# Altium schematic sheet CAN-Sheet.SchDoc
size 420 x 297 mm; SheetNumber: 4; SheetTotal: 7
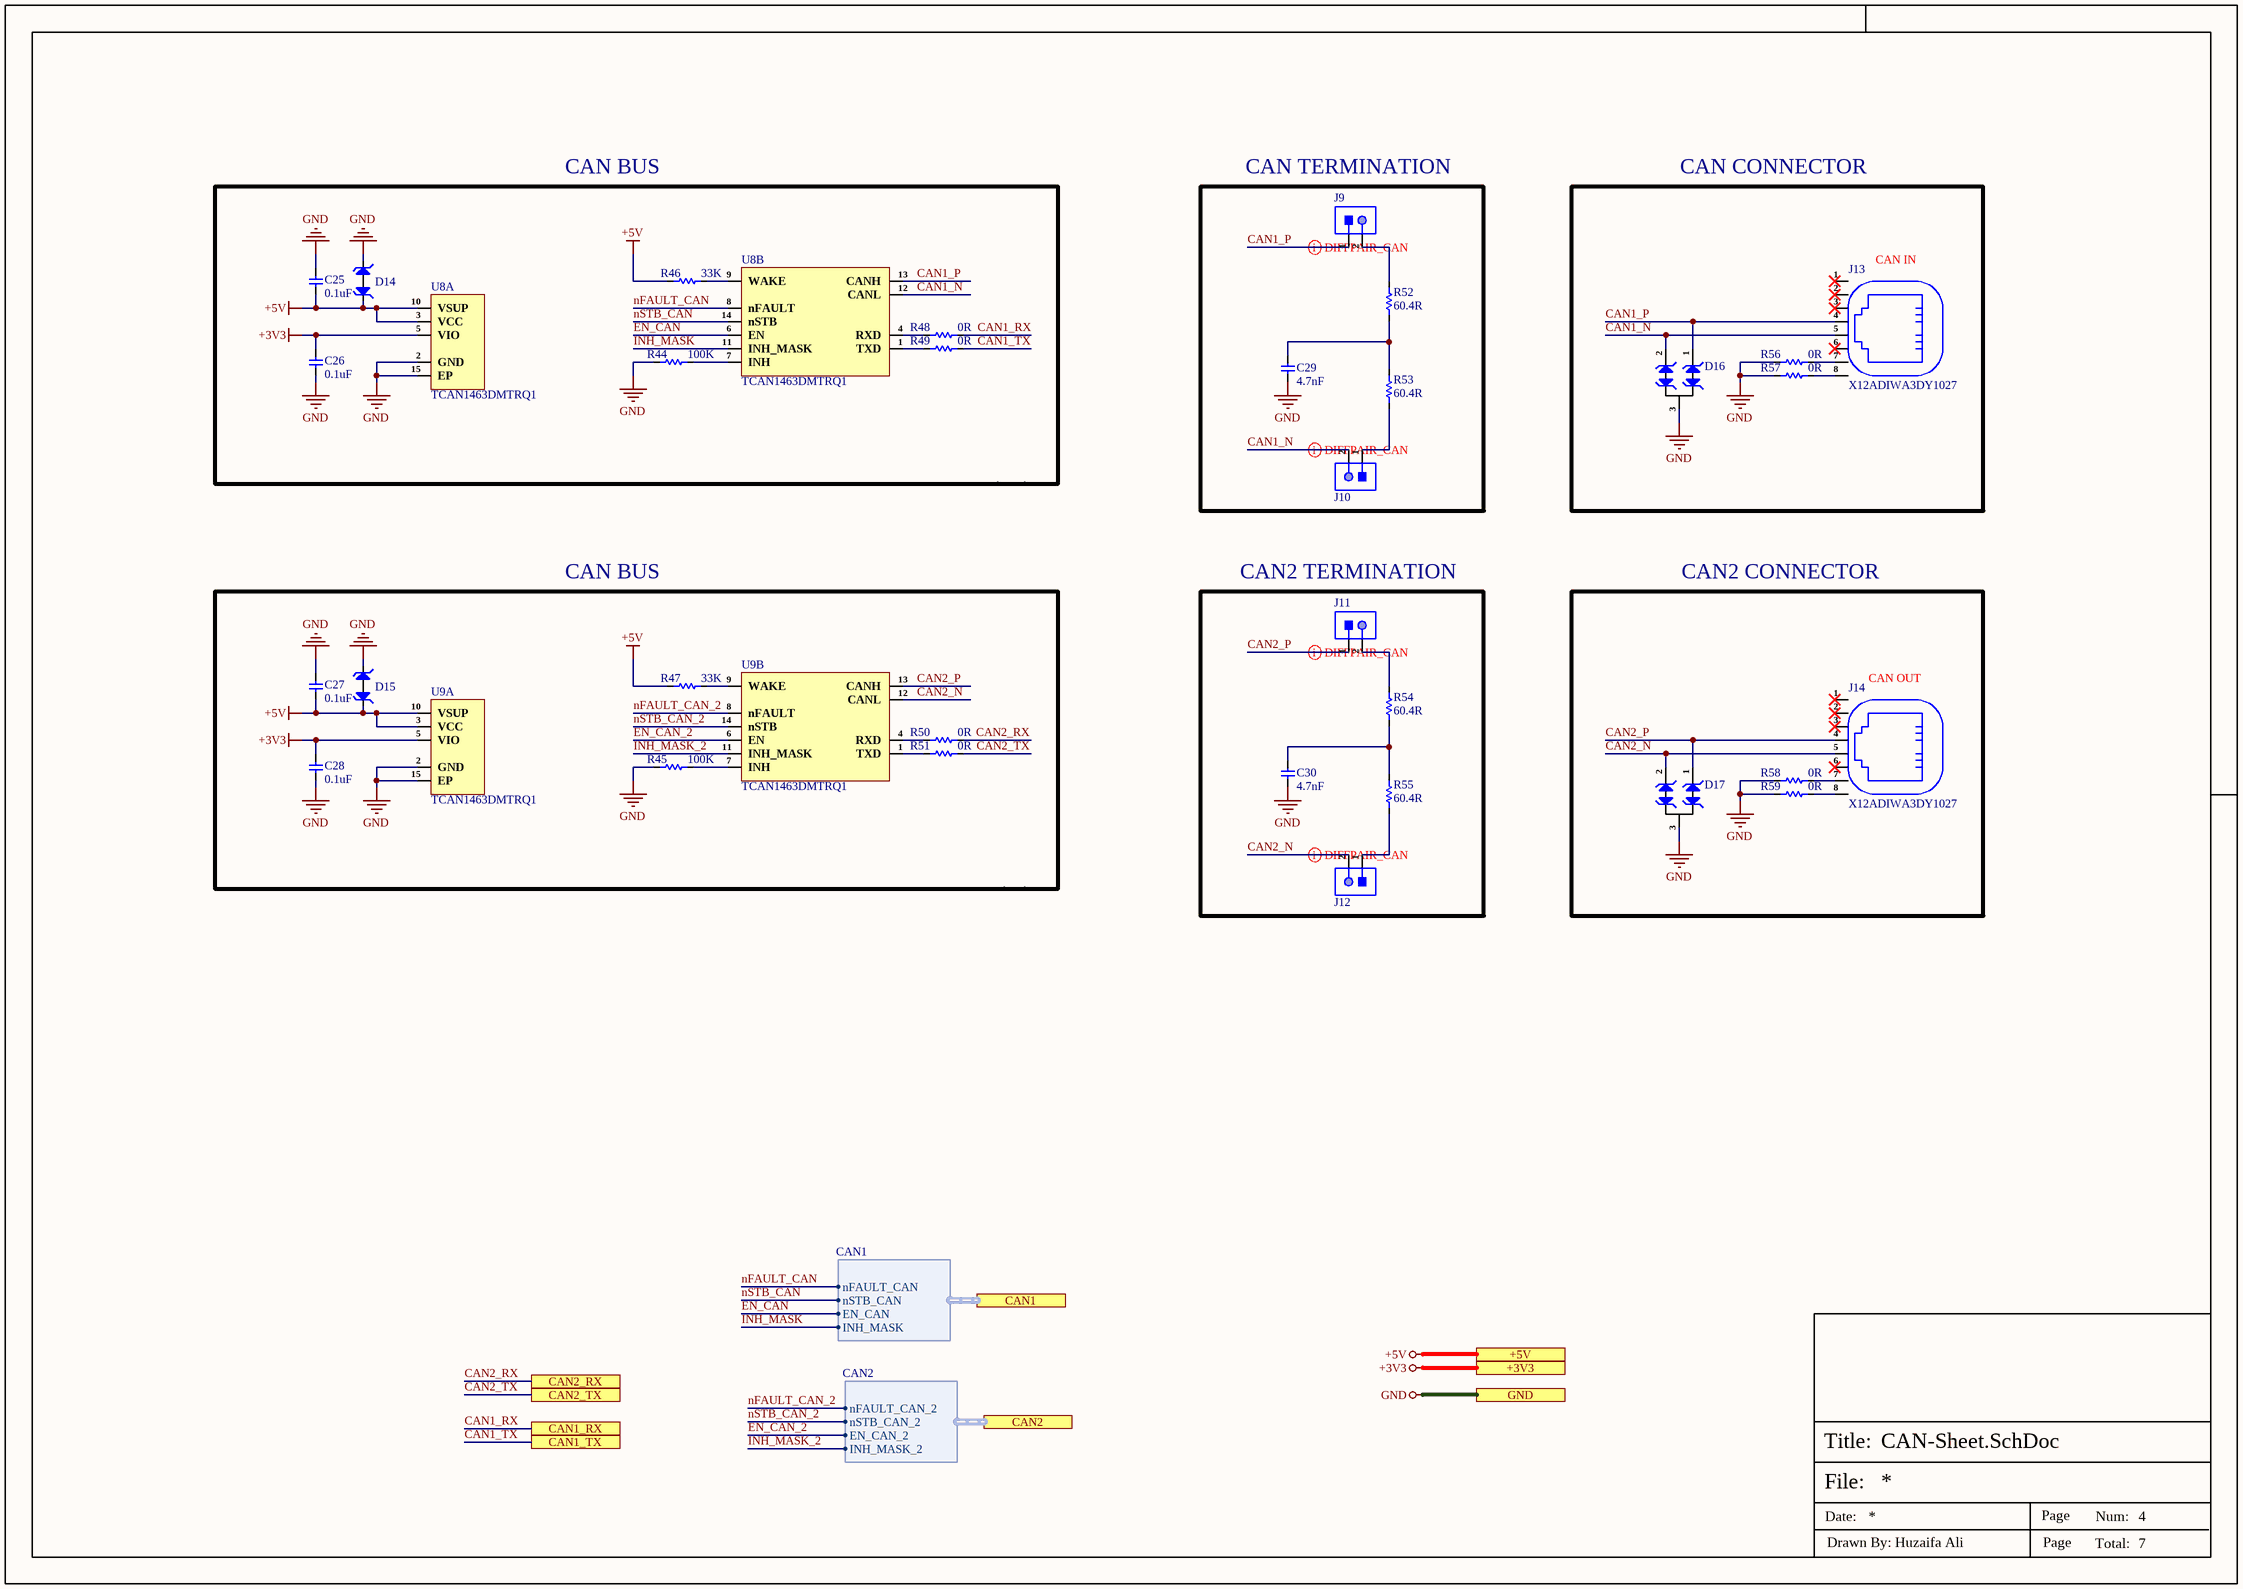
[diagram p0: CAN-Sheet.SchDoc]

## Parts
C25  0.1uF  [Cap-0402]
C26  0.1uF  [Cap-0402]
C27  0.1uF  [Cap-0402]
C28  0.1uF  [Cap-0402]
C29  4.7nF  [Cap-0402]
C30  4.7nF  [Cap-0402]
D14  PESD5V0H1BSFYL  [DSN0603-2]  (value not drawn)
D15  PESD5V0H1BSFYL  [DSN0603-2]  (value not drawn)
D16  CDSOT23-T24CAN-Q  [SOT-23]  (value not drawn)
D17  CDSOT23-T24CAN-Q  [SOT-23]  (value not drawn)
J9  X6511WV-02H-C60D30  [HDR1X2_]  (value not drawn)
J10  X6511WV-02H-C60D30  [HDR1X2_]  (value not drawn)
J11  X6511WV-02H-C60D30  [HDR1X2_]  (value not drawn)
J12  X6511WV-02H-C60D30  [HDR1X2_]  (value not drawn)
J13  X12ADIWA3DY1027  [X12ADIWA3DY1027]
J14  X12ADIWA3DY1027  [X12ADIWA3DY1027]
R44  100K  [Res-0402]
R45  100K  [Res-0402]
R46  33K  [Res-0402]
R47  33K  [Res-0402]
R48  0R  [Res-0402]
R49  0R  [Res-0402]
R50  0R  [Res-0402]
R51  0R  [Res-0402]
R52  60.4R  [Res-0603]
R53  60.4R  [Res-0603]
R54  60.4R  [Res-0603]
R55  60.4R  [Res-0603]
R56  0R  [Res-0402]
R57  0R  [Res-0402]
R58  0R  [Res-0402]
R59  0R  [Res-0402]
U8  TCAN1463DMTRQ1  [VSON-14(3x4.5)]  (parts A,B of 2)
U9  TCAN1463DMTRQ1  [VSON-14(3x4.5)]  (parts A,B of 2)

## Blocks framed on the sheet
CAN IN: D16 J13 R56 R57
CAN OUT: D17 J14 R58 R59

## Ports
+3V3 (see Top-Sheet[5A], Controller-Sheet[5D], EtherCAT-Sheet[5D], Power-Sheet[5D], RS485-RS232-Sheet[5D]), +5V (see Top-Sheet[5A], Power-Sheet[5D]), CAN1 (harness CAN1, see Top-Sheet[5B], Controller-Sheet[4D]), CAN1_RX (see Top-Sheet[5B], Controller-Sheet[5D]), CAN1_TX (see Top-Sheet[5B], Controller-Sheet[5D]), CAN2 (harness CAN2, see Top-Sheet[5B], Controller-Sheet[4D]), CAN2_RX (see Top-Sheet[5B], Controller-Sheet[5D]), CAN2_TX (see Top-Sheet[5B], Controller-Sheet[5D]), GND (see Top-Sheet[5A], Connector-Sheet[5D], Controller-Sheet[5D], EtherCAT-Sheet[5D], Power-Sheet[5D], RS485-RS232-Sheet[5D])

## Harnesses
CAN1: nFAULT_CAN, nSTB_CAN, EN_CAN, INH_MASK
CAN2: nFAULT_CAN_2, nSTB_CAN_2, EN_CAN_2, INH_MASK_2

## Nets
+3V3: C26.2 C28.2 U8.5(VIO) U9.5(VIO) ; port +3V3
+5V: C25.1 C27.1 D14.1 D15.1 R46.1 R47.1 U8.3(VCC) U8.10(VSUP) U9.3(VCC) U9.10(VSUP) ; port +5V
GND: C25.2 C26.1 C27.2 C28.1 C29.2 C30.2 D14.2 D15.2 D16.3 D17.3 R44.1 R45.1 R56.1 R57.1 R58.1 R59.1 U8.2(GND) U8.15(EP) U9.2(GND) U9.15(EP) ; port GND
CAN1_N: D16.2 J10.2 J13.5 U8.12(CANL)
CAN1_P: D16.1 J9.1 J13.4 U8.13(CANH)
CAN1_RX: R48.2 ; port CAN1_RX
CAN1_TX: R49.2 ; port CAN1_TX
CAN2_N: D17.2 J12.2 J14.5 U9.12(CANL)
CAN2_P: D17.1 J11.1 J14.4 U9.13(CANH)
CAN2_RX: R50.2 ; port CAN2_RX
CAN2_TX: R51.2 ; port CAN2_TX
EN_CAN: U8.6(EN) ; port CAN1.EN_CAN
EN_CAN_2: U9.6(EN) ; port CAN2.EN_CAN_2
INH_MASK: U8.11(INH_MASK) ; port CAN1.INH_MASK
INH_MASK_2: U9.11(INH_MASK) ; port CAN2.INH_MASK_2
nFAULT_CAN: U8.8(nFAULT) ; port CAN1.nFAULT_CAN
nFAULT_CAN_2: U9.8(nFAULT) ; port CAN2.nFAULT_CAN_2
nSTB_CAN: U8.14(nSTB) ; port CAN1.nSTB_CAN
nSTB_CAN_2: U9.14(nSTB) ; port CAN2.nSTB_CAN_2
NetC29_1: C29.1 R52.2 R53.1
NetC30_1: C30.1 R54.2 R55.1
NetJ9_2: J9.2 R52.1
NetJ10_1: J10.1 R53.2
NetJ11_2: J11.2 R54.1
NetJ12_1: J12.1 R55.2
NetJ13_7: J13.7 R56.2
NetJ13_8: J13.8 R57.2
NetJ14_7: J14.7 R58.2
NetJ14_8: J14.8 R59.2
NetR44_2: R44.2 U8.7(INH)
NetR45_2: R45.2 U9.7(INH)
NetR46_2: R46.2 U8.9(WAKE)
NetR47_2: R47.2 U9.9(WAKE)
NetR48_1: R48.1 U8.4(RXD)
NetR49_1: R49.1 U8.1(TXD)
NetR50_1: R50.1 U9.4(RXD)
NetR51_1: R51.1 U9.1(TXD)

Not connected (* = marked no-connect by the designer): J13 1* 2* 3* 6*; J14 1* 2* 3* 6*

## Layout directives
differential pair; net class CAN; differential pair class CAN_Lines: CAN1_N, CAN1_P, CAN2_N, CAN2_P

## Notes on the sheet
- CAN BUS
- CAN TERMINATION
- CAN CONNECTOR
- CAN2 TERMINATION
- CAN2 CONNECTOR
- File:
- Title:
- Date:
- Page
- Num:
- Total:
- Drawn By: Huzaifa Ali

## Library data of the parts
C25-C28 = CC0402JRX7R7BB104: CAP CER 0.1UF 16V X7R 0402; Manufacturer: Yageo; Material: 4241ConductorMaterial; Value: 100nF; Tolerance: 5%; Item Type: Capacitor; Supplier: Digikey; Supplier Part Number: 311-1676-1-ND; Manufacturer Part Number: CC0402JRX7R7BB104; RoHS: Yes; Category: Ceramic Capacitors; Stock: 1659111; Pricing: 1=0.1, 10=0.046, 50=0.0262, 100=0.0203, 500=0.01528, 1000=0.012, 2500=0.01091, 5000=0.01004 (USD); Mounting Technology: Surface Mount; Case/Package: 0402; Case Code (Metric): 1005; Case Code (Imperial): 0402; Min Operating Temperature: -55°C; Max Operating Temperature: 125°C; Dielectric: X7R; Packaging: Tape and Reel; Package Quantity: 10000; Voltage Rating (DC): 16V; Voltage Rating: 16V; Series: CC; Construction: Flat; Length: 0.039inch; Width: 0.02inch; Height: 0.5mm; Thickness: 0.022inch; Lead Free: Lead Free; Halogen Free: Halogen Free; RoHS Compliant: Yes; ComponentLink1URL: https://datasheet.ciiva.com/13210/upy-gphc-x7r-6-3v-to-50v-8-12304-13210152.pdf?src-supplier=Mouser; ComponentLink1Description: https://datasheet.ciiva.com/13210/upy-gphc-x7r-6-3v-to-50v-8-12304-13210152.pdf?src-supplier=Mouser; LCSC Part Number: C541464
C29 C30 = CC0402KRX7R9BB472: CAP CER 4700PF 50V X7R 0402; Manufacturer: Yageo; Material: 4241ConductorMaterial; Tolerance: 10%; Temperature Coefficient: 30ppm/°C; Item Type: Capacitor; Supplier 1: Future Electronics; Manufacturer Part Number: CC0402KRX7R9BB472; RoHS: Yes; Category: Ceramic Capacitors; Stock 1: 1780000; Pricing 1: 10000=0.0021, 40000=0.002, 150000=0.0019, 400000=0.0018, 1000000=0.0017 (USD); Mount: Surface Mount; Case/Package: 0402; Number of Pins: 2NUMBER; Case Code (Imperial): 0402; Case Code (Metric): 1005; Min Operating Temperature: -55°C; Max Operating Temperature: 125°C; Capacitance: 4.7nF; Dielectric: X7R; Voltage Rating: 50V; Voltage Rating (DC): 50V; Packaging: Tape and Reel; Package Quantity: 1; Termination: SMD/SMT; Series: CC; Construction: Flat; Length: 1mm; Width: 0.02inch; Height: 0.5mm; Thickness: 0.022inch; Depth: 0.5mm; Radiation Hardening: No; Reach SVHC Compliant: No; RoHS Compliant: Yes; Halogen Free: 5694HalogenFree; Lead Free: 5697LeadFree; ComponentLink1URL: https://datasheet.ciiva.com/7978/1489800-7978108.pdf?src-supplier=Element14; ComponentLink1Description: https://datasheet.ciiva.com/7978/1489800-7978108.pdf?src-supplier=Element14; ComponentLink2URL: https://datasheet.ciiva.com/176/mlccorderingcode-176364.pdf?src-supplier=Digikey; ComponentLink2Description: https://datasheet.ciiva.com/176/mlccorderingcode-176364.pdf?src-supplier=Digikey; ComponentLink3URL: https://datasheet.ciiva.com/176/mlccorderingcode-176363.pdf?src-supplier=Digikey; ComponentLink3Description: https://datasheet.ciiva.com/176/mlccorderingcode-176363.pdf?src-supplier=Digikey; ComponentLink4URL: https://datasheet.ciiva.com/176/mlccorderingcode-176365.pdf?src-supplier=Digikey; ComponentLink4Description: https://datasheet.ciiva.com/176/mlccorderingcode-176365.pdf?src-supplier=Digikey; ComponentLink5URL: https://datasheet.ciiva.com/11586/upy-gphc-x7r-6-3v-to-50v-8-11586491.pdf?src-supplier=Avnet; ComponentLink5Description: https://datasheet.ciiva.com/11586/upy-gphc-x7r-6-3v-to-50v-8-11586491.pdf?src-supplier=Avnet; Supplier Part Number 1: 1989300
D14 D15 = PESD5V0H1BSFYL: TVS DIODE 5VWM 6.3VC DSN0603-2; Manufacturer: Nexperia; Supplier 1: Avnet; Manufacturer Part Number: PESD5V0H1BSFYL; RoHS: Yes; Category: ESD and Circuit Protection ICs; Stock 1: 9000; Pricing 1: 18000=0.06453, 36000=0.06278, 54000=0.06104, 90000=0.05930, 180000=0.05755, 900000=0.05581, 1800000=0.05406 (USD); RoHS Compliant: Yes; ComponentLink1URL: http://www.farnell.com/datasheets/1961312.pdf?src-supplier=Farnell; ComponentLink1Description: http://www.farnell.com/datasheets/1961312.pdf?src-supplier=Farnell; ComponentLink2URL: https://assets.nexperia.com/documents/data-sheet/PESD5V0H1BSF.pdf?src-supplier=Digi-Key; ComponentLink2Description: https://assets.nexperia.com/documents/data-sheet/PESD5V0H1BSF.pdf?src-supplier=Digi-Key; ComponentLink3URL: http://www.farnell.com/datasheets/1961312.pdf?src-supplier=Newark; ComponentLink3Description: http://www.farnell.com/datasheets/1961312.pdf?src-supplier=Newark; Supplier Part Number 1: PESD5V0H1BSFYL; LCSC Part Number: C477989; Item Type: Diode
D16 D17 = CDSOT23-T24CAN-Q: TVS DIODE 24VWM 40VC SOT23-3; Manufacturer: Bourns; Item Type: TVS Diodes; Supplier: Digikey; LCSC Part Number: C350941; Manufacturer Part Number: CDSOT23-T24CAN-Q; RoHS: Yes; Stock: 17231; Pricing: 1=0.36, 10=0.282, 100=0.1691, 500=0.15656, 1000=0.10645, 3000=0.098, 6000=0.09393, 9000=0.08454, 30000=0.08328, 75000=0.07827 (USD); RoHS Compliant: 5897YesNo; ComponentLink1URL: http://www.farnell.com/datasheets/2372435.pdf?src-supplier=Farnell; ComponentLink1Description: http://www.farnell.com/datasheets/2372435.pdf?src-supplier=Farnell; ComponentLink2URL: https://www.bourns.com/docs/Product-Datasheets/cdsot23-t24can-Q.pdf?src-supplier=Digikey; ComponentLink2Description: https://www.bourns.com/docs/Product-Datasheets/cdsot23-t24can-Q.pdf?src-supplier=Digikey; ComponentLink3URL: http://www.farnell.com/datasheets/2372435.pdf?src-supplier=Newark; ComponentLink3Description: http://www.farnell.com/datasheets/2372435.pdf?src-supplier=Newark
J9-J12 = X6511WV-02H-C60D30: Gold 250V 3A Straight Square Pins 2.5mm 2P 260℃ 6mm -40℃~+105℃ 3mm 2.54mm Plugin Black Brass 1x2P Plugin,P=2.54mm Pin Headers ROHS; Manufacturer: XKB; Item Type: Male Header; Manufacturer Part Number: X6511WV-02H-C60D30; Package: Plugin,P=2.54mm; LCSC Part Number: C706874; ComponentLink1Description: LCSC; ComponentLink1URL: https://www.lcsc.com/product-detail/Pin-Headers_XKB-Connectivity-X6511WV-02H-C60D30_C706874.html
J13 J14 = X12ADIWA3DY1027: RJ45Receptacle Unshielded 1 Bend insert 260℃ Gold Phosphor Bronze Without LED -40℃~+85℃ Plugin Ethernet Connectors / Modular Connectors (RJ45 RJ11) ROHS; Manufacturer: XKB Connection; Manufacturer Part Number: X12ADIWA3DY1027; Package: Plugin; LCSC Part Number: C2916460; Item Type: Connectors (RJ45 RJ11); ComponentLink1Description: LCSC; ComponentLink1URL: https://www.lcsc.com/product-detail/Ethernet-Connectors-Modular-Connectors-RJ45-RJ11_XKB-Connection-X12ADIWA3DY1027_C2916460.html
R44 R45 = RC0402FR-07100KL: RES 100K OHM 1% 1/16W 0402; Manufacturer: Yageo; Resistance: 100kR; Temperature Coefficient: 100ppm/°C; Power Rating: 63mW; Voltage Rating: 50V; Item Type: Resistor; Supplier 1: Mouser; Manufacturer Part Number: RC0402FR-07100KL; RoHS: Yes; Category: Chip SMD Resistors; Stock 1: 7759549; Pricing 1: 1=0.10000, 10=0.01200, 50=0.01200, 100=0.00500, 1000=0.00300, 2500=0.00200, 10000=0.00100 (USD); Case/Package: 0402; Case Code (Metric): 1005; Case Code (Imperial): 0402; Min Operating Temperature: -55°C; Max Operating Temperature: 155°C; Resistor Type: Thick Film; Tolerance: 1%; Packaging: Tape and Reel; Package Quantity: 1; Number of Terminations: 2; Termination: SMD/SMT; Max Power Dissipation: 63mW; Working Voltage: 50V; Features: Moisture Resistant; Series: RC; Resistance Tolerance: 1%; Construction: Rectangular; Technology: THICK FILM; Length: 0.039inch; Width: 0.02inch; Height: 0.016inch; Depth: 0.5mm; REACH SVHC: No SVHC; Lead Free: Lead Free; RoHS Compliant: Yes; Military Standard: Not; ComponentLink1URL: https://datasheet.ciiva.com/11819/0900766b80c66297-11819452.pdf?src-supplier=RSComponents; ComponentLink1Description: https://datasheet.ciiva.com/11819/0900766b80c66297-11819452.pdf?src-supplier=RSComponents; ComponentLink2URL: https://datasheet.ciiva.com/22747/1018594-22747509.pdf?src-supplier=Element14; ComponentLink2Description: https://datasheet.ciiva.com/22747/1018594-22747509.pdf?src-supplier=Element14; ComponentLink3URL: https://datasheet.ciiva.com/2453/pyu-r-int-thick-7-2453362.pdf?src-supplier=Digi-Key; ComponentLink3Description: https://datasheet.ciiva.com/2453/pyu-r-int-thick-7-2453362.pdf?src-supplier=Digi-Key; ComponentLink4URL: https://datasheet.ciiva.com/2453/pyu-r-int-thick-7-2453363.pdf?src-supplier=Digi-Key; ComponentLink4Description: https://datasheet.ciiva.com/2453/pyu-r-int-thick-7-2453363.pdf?src-supplier=Digi-Key; ComponentLink5URL: https://datasheet.ciiva.com/2453/pyu-r-int-thick-7-2453361.pdf?src-supplier=Digi-Key; ComponentLink5Description: https://datasheet.ciiva.com/2453/pyu-r-int-thick-7-2453361.pdf?src-supplier=Digi-Key; ComponentLink6URL: https://datasheet.ciiva.com/12667/pyu-rc0402-51-rohs-l-6-r-12667930.pdf?src-supplier=Mouser; ComponentLink6Description: https://datasheet.ciiva.com/12667/pyu-rc0402-51-rohs-l-6-r-12667930.pdf?src-supplier=Mouser; ComponentLink7URL: https://datasheet.ciiva.com/15189/getdatasheetpartid-323696-15189334.pdf?src-supplier=Verical; ComponentLink7Description: https://datasheet.ciiva.com/15189/getdatasheetpartid-323696-15189334.pdf?src-supplier=Verical; Supplier Part Number 1: 603-RC0402FR-07100KL; LCSC Part Number: C60491
R46 R47 = RC0402FR-0733KL: RES 33K OHM 1% 1/16W 0402; Manufacturer: YAGEO; Item Type: Resistor; Manufacturer Part Number: RC0402FR-0733KL; Package: 0402; LCSC Part Number: C138003; ComponentLink1Description: LCSC; ComponentLink1URL: https://www.lcsc.com/product-detail/Chip-Resistor-Surface-Mount_YAGEO-RC0402FR-0733KL_C138003.html
R48-R51 R56-R59 = RC0402FR-070RL: RES 0 OHM JUMPER 1/16W 0402; Manufacturer: Yageo; Item Type: Resistors; Tolerance: 1%; Power Rating: 62.5mW; Voltage Rating: 50V; Temperature Coefficient: 200ppm/°C; Max Power Dissipation: 63mW; Supplier 1: Mouser; Manufacturer Part Number: RC0402FR-070RL; RoHS: Yes; Stock 1: 8556842; Pricing 1: 1=0.10000, 10=0.01400, 50=0.01400, 100=0.00600, 1000=0.00300, 5000=0.00200, 10000=0.00100 (USD); Mount: Surface Mount; Case/Package: 0402; Contact Plating: Tin,Matte; Case Code (Imperial): 0402; Case Code (Metric): 1005; Size Code: 0402; Min Operating Temperature: -55°C; Max Operating Temperature: 155°C; Resistance: 0R; Resistor Type: Thick Film; Packaging: Tape and Reel; Termination: SMD/SMT; Features: Moisture Resistant; Series: RC; Number of Terminations: 2; Length: 1mm; Width: 0.5mm; Height: 0.35mm; Radiation Hardening: No; Lead Free: Lead Free; RoHS Compliant: Yes; ComponentLink1URL: https://datasheet.ciiva.com/8896/pyu-rc0402-51-rohs-l-6-8896149.pdf?src-supplier=Avnet; ComponentLink1Description: https://datasheet.ciiva.com/8896/pyu-rc0402-51-rohs-l-6-8896149.pdf?src-supplier=Avnet; ComponentLink2URL: https://datasheet.ciiva.com/16790/pyu-rc0402-51-rohs-l-6-r-16790444.pdf?src-supplier=Future+Electronics; ComponentLink2Description: https://datasheet.ciiva.com/16790/pyu-rc0402-51-rohs-l-6-r-16790444.pdf?src-supplier=Future+Electronics; Supplier Part Number 1: 603-RC0402FR-070RL; LCSC Part Number: C106231
R52-R55 = RTT0360R4FTP: 100mW Thick Film Resistors ±100ppm/℃ ±1% 60.4Ω 0603 Chip Resistor - Surface Mount ROHS; Manuacturer: RALEC; Manufacturer Part Number: RTT0360R4FTP; Package: 0603; Value: 60.4R; LCSC Part Number: C103744; ComponentLink1Description: LCSC; ComponentLink1URL: https://www.lcsc.com/product-detail/Chip-Resistor-Surface-Mount_RALEC-RTT0360R4FTP_C103744.html
U8 U9 = TCAN1463DMTRQ1: IC TRANSCEIVER HALF 1/1 14VSON; Manufacturer: Texas Instruments; Supplier: Mouser; Supplier Part Number: 595-TCAN1463DMTRQ1; Manufacturer Part Number: TCAN1463DMTRQ1; RoHS: Yes; Item Type: IC; Stock: 20610; Pricing: 1=2.47, 10=2.22, 50=2.22, 100=1.78, 1000=1.21, 10000=1.09 (USD); LCSC Part Number: C5215823